# Altium schematic sheet TP4_Compact_FMC_Sht1.SchDoc
size B; SheetNumber: 1; SheetTotal: 2
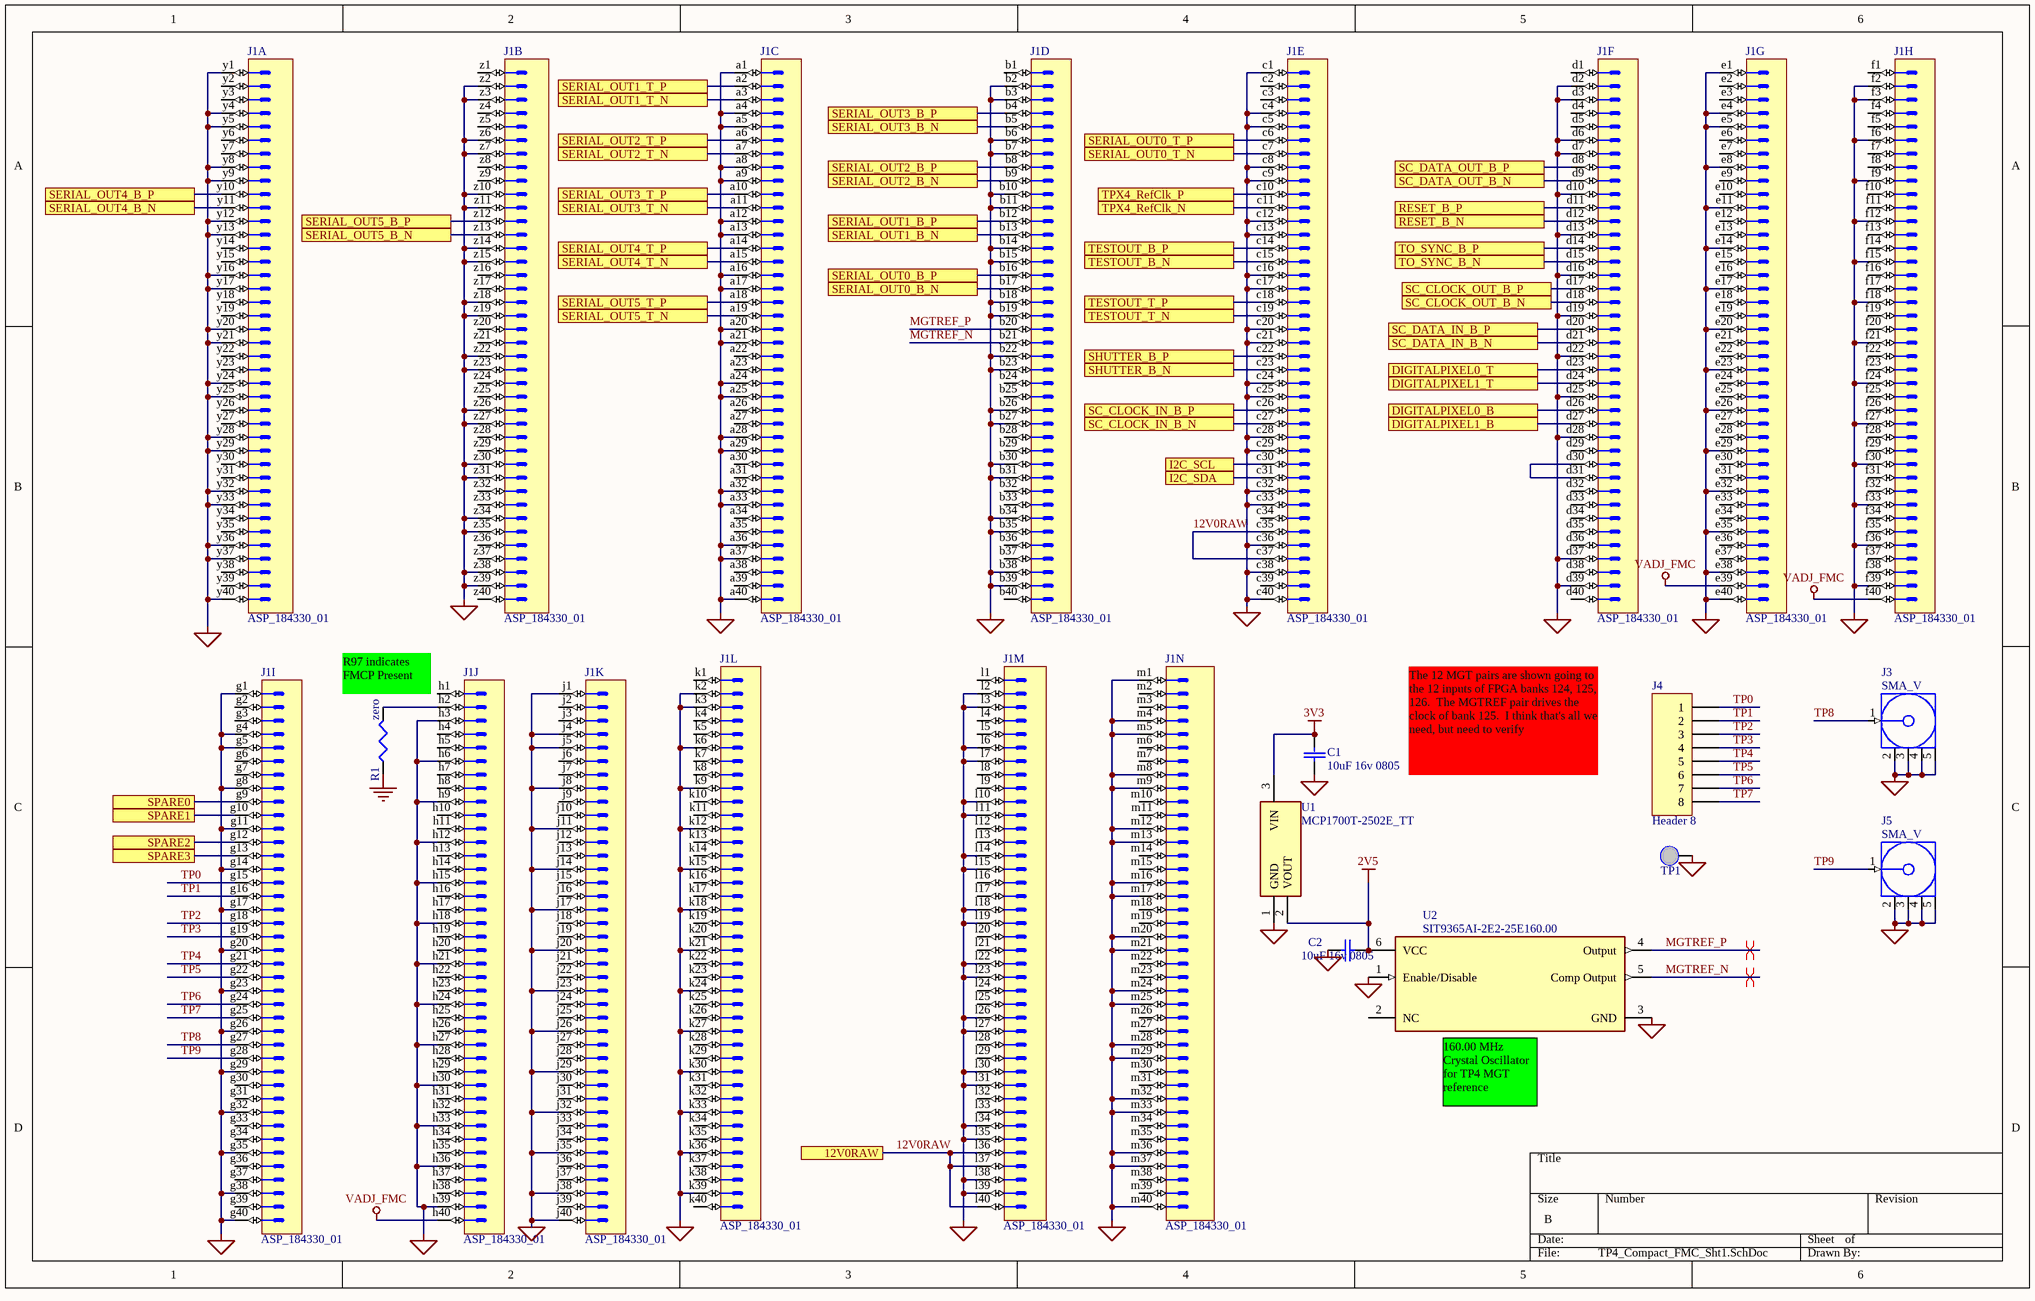
[diagram p0: TP4_Compact_FMC_Sht1.SchDoc]

## Parts
C1  value 10uF 16v 0805  [CAP0805]  (hidden comment: Cap)
C2  value 10uF 16v 0805  [CAP0805]  (hidden comment: Cap)
J1  ASP_184330_01  [SAMTEC_ASP_184330_01]  (parts A,B,C,D,E,F,G,H,I,J,K,L,M,N of 14)
J3  SMA_V  [SMA_Vert]
J4  Header 8  [HDR1X8]
J5  SMA_V  [SMA_Vert]
R1  value zero  [CAP0805]  (hidden comment: Res)
TP1  through-hole pad  [Pin1]  (value not drawn)
U1  MCP1700T-2502E_TT  [SOT95P237X112-3N]
U2  SIT9365AI-2E2-25E160.00  [osc_7mm_5mm]

## Ports
12V0RAW (see TP4_Compact_FMC_Sht2[1A]), DIGITALPIXEL0_B (see TP4_Compact_FMC_Sht2[6B]), DIGITALPIXEL0_T (see TP4_Compact_FMC_Sht2[6B]), DIGITALPIXEL1_B (see TP4_Compact_FMC_Sht2[6B]), DIGITALPIXEL1_T (see TP4_Compact_FMC_Sht2[6B]), I2C_SCL (see TP4_Compact_FMC_Sht2[4C]), I2C_SDA (see TP4_Compact_FMC_Sht2[6C]), RESET_B_N (see TP4_Compact_FMC_Sht2[4B]), RESET_B_P (see TP4_Compact_FMC_Sht2[4B]), SC_CLOCK_IN_B_N (see TP4_Compact_FMC_Sht2[4B]), SC_CLOCK_IN_B_P (see TP4_Compact_FMC_Sht2[4B]), SC_CLOCK_OUT_B_N (see TP4_Compact_FMC_Sht2[6B]), SC_CLOCK_OUT_B_P (see TP4_Compact_FMC_Sht2[6B]), SC_DATA_IN_B_N (see TP4_Compact_FMC_Sht2[6B]), SC_DATA_IN_B_P (see TP4_Compact_FMC_Sht2[6B]), SC_DATA_OUT_B_N (see TP4_Compact_FMC_Sht2[4B]), SC_DATA_OUT_B_P (see TP4_Compact_FMC_Sht2[4B]), SERIAL_OUT0_B_N (see TP4_Compact_FMC_Sht2[4A]), SERIAL_OUT0_B_P (see TP4_Compact_FMC_Sht2[4A]), SERIAL_OUT0_T_N (see TP4_Compact_FMC_Sht2[4A]), SERIAL_OUT0_T_P (see TP4_Compact_FMC_Sht2[4A]), SERIAL_OUT1_B_N (see TP4_Compact_FMC_Sht2[6A]), SERIAL_OUT1_B_P (see TP4_Compact_FMC_Sht2[6A]), SERIAL_OUT1_T_N (see TP4_Compact_FMC_Sht2[4A]), SERIAL_OUT1_T_P (see TP4_Compact_FMC_Sht2[4A]), SERIAL_OUT2_B_N (see TP4_Compact_FMC_Sht2[4A]), SERIAL_OUT2_B_P (see TP4_Compact_FMC_Sht2[4A]), SERIAL_OUT2_T_N (see TP4_Compact_FMC_Sht2[6A]), SERIAL_OUT2_T_P (see TP4_Compact_FMC_Sht2[6A]), SERIAL_OUT3_B_N (see TP4_Compact_FMC_Sht2[4A]), SERIAL_OUT3_B_P (see TP4_Compact_FMC_Sht2[4A]), SERIAL_OUT3_T_N (see TP4_Compact_FMC_Sht2[4A]), SERIAL_OUT3_T_P (see TP4_Compact_FMC_Sht2[4A]), SERIAL_OUT4_B_N (see TP4_Compact_FMC_Sht2[6A]), SERIAL_OUT4_B_P (see TP4_Compact_FMC_Sht2[6A]), SERIAL_OUT4_T_N (see TP4_Compact_FMC_Sht2[6A]), SERIAL_OUT4_T_P (see TP4_Compact_FMC_Sht2[6A]), SERIAL_OUT5_B_N (see TP4_Compact_FMC_Sht2[6A]), SERIAL_OUT5_B_P (see TP4_Compact_FMC_Sht2[6A]), SERIAL_OUT5_T_N (see TP4_Compact_FMC_Sht2[6A]), SERIAL_OUT5_T_P (see TP4_Compact_FMC_Sht2[6A]), SHUTTER_B_N (see TP4_Compact_FMC_Sht2[6B]), SHUTTER_B_P (see TP4_Compact_FMC_Sht2[6B]), SPARE0 (see TP4_Compact_FMC_Sht2[6B]), SPARE1 (see TP4_Compact_FMC_Sht2[6B]), SPARE2 (see TP4_Compact_FMC_Sht2[6B]), SPARE3 (see TP4_Compact_FMC_Sht2[6B]), TESTOUT_B_N (see TP4_Compact_FMC_Sht2[4B]), TESTOUT_B_P (see TP4_Compact_FMC_Sht2[4B]), TESTOUT_T_N (see TP4_Compact_FMC_Sht2[4B]), TESTOUT_T_P (see TP4_Compact_FMC_Sht2[4B]), TO_SYNC_B_N (see TP4_Compact_FMC_Sht2[4B]), TO_SYNC_B_P (see TP4_Compact_FMC_Sht2[4B]), TPX4_RefClk_N (see TP4_Compact_FMC_Sht2[4B]), TPX4_RefClk_P (see TP4_Compact_FMC_Sht2[4B])

## Nets
2V5: C2.1 U1.2(VOUT) U2.6(VCC)
3V3: C1.1 U1.3(VIN)
GND: C1.2 C2.2 J1.a1 J1.a4 J1.a5 J1.a8 J1.a9 J1.a12 J1.a13 J1.a16 J1.a17 J1.a20 J1.a21 J1.a24 J1.a25 J1.a28 J1.a29 J1.a32 J1.a33 J1.a36 J1.a37 J1.a40 J1.b2 J1.b3 J1.b6 J1.b7 J1.b10 J1.b11 J1.b14 J1.b15 J1.b18 J1.b19 J1.b22 J1.b23 J1.b26 J1.b27 J1.b30 J1.b31 J1.b34 J1.b35 J1.b38 J1.b39 J1.c1 J1.c4 J1.c5 J1.c8 J1.c9 J1.c12 J1.c13 J1.c16 J1.c17 J1.c20 J1.c21 J1.c24 J1.c25 J1.c28 J1.c29 J1.c32 J1.c33 J1.c36 J1.c38 J1.c40 J1.d2 J1.d3 J1.d6 J1.d7 J1.d10 J1.d13 J1.d16 J1.d19 J1.d22 J1.d25 J1.d28 J1.d37 J1.d39 J1.e1 J1.e4 J1.e5 J1.e8 J1.e11 J1.e14 J1.e17 J1.e20 J1.e23 J1.e26 J1.e29 J1.e32 J1.e35 J1.e38 J1.e40 J1.f2 J1.f3 J1.f6 J1.f9 J1.f12 J1.f15 J1.f18 J1.f21 J1.f24 J1.f27 J1.f30 J1.f33 J1.f36 J1.f39 J1.g1 J1.g4 J1.g5 J1.g8 J1.g11 J1.g14 J1.g17 J1.g20 J1.g23 J1.g26 J1.g29 J1.g32 J1.g35 J1.g38 J1.g40 J1.h3 J1.h6 J1.h9 J1.h12 J1.h15 J1.h18 J1.h21 J1.h24 J1.h27 J1.h30 J1.h33 J1.h36 J1.h39 J1.j1 J1.j4 J1.j5 J1.j8 J1.j11 J1.j14 J1.j17 J1.j20 J1.j23 J1.j26 J1.j29 J1.j32 J1.j35 J1.j38 J1.j40 J1.k2 J1.k3 J1.k6 J1.k9 J1.k12 J1.k15 J1.k18 J1.k21 J1.k24 J1.k27 J1.k30 J1.k33 J1.k36 J1.k39 J1.l2 J1.l3 J1.l6 J1.l7 J1.l10 J1.l11 J1.l14 J1.l15 J1.l18 J1.l19 J1.l22 J1.l23 J1.l26 J1.l27 J1.l30 J1.l31 J1.l34 J1.l35 J1.l38 J1.l39 J1.m1 J1.m4 J1.m5 J1.m8 J1.m9 J1.m12 J1.m13 J1.m16 J1.m17 J1.m20 J1.m21 J1.m24 J1.m25 J1.m28 J1.m29 J1.m32 J1.m33 J1.m36 J1.m37 J1.m40 J1.y1 J1.y4 J1.y5 J1.y8 J1.y9 J1.y12 J1.y13 J1.y16 J1.y17 J1.y20 J1.y21 J1.y24 J1.y25 J1.y28 J1.y29 J1.y32 J1.y33 J1.y36 J1.y37 J1.y40 J1.z2 J1.z3 J1.z6 J1.z7 J1.z10 J1.z11 J1.z14 J1.z15 J1.z18 J1.z19 J1.z22 J1.z23 J1.z26 J1.z27 J1.z30 J1.z31 J1.z34 J1.z35 J1.z38 J1.z39 J3.2(GND) J3.3(GND) J3.4(GND) J3.5(GND) J5.2(GND) J5.3(GND) J5.4(GND) J5.5(GND) R1.1 TP1.1 U1.1(GND) U2.1(Enable/Disable) U2.3(GND)
VADJ_FMC: J1.e39 J1.f40 J1.h40
12V0RAW: J1.c35 J1.c37 J1.l36 J1.l37 J1.l40 ; port 12V0RAW
DIGITALPIXEL0_B: J1.d26 ; port DIGITALPIXEL0_B
DIGITALPIXEL0_T: J1.d23 ; port DIGITALPIXEL0_T
DIGITALPIXEL1_B: J1.d27 ; port DIGITALPIXEL1_B
DIGITALPIXEL1_T: J1.d24 ; port DIGITALPIXEL1_T
I2C_SCL: J1.c30 ; port I2C_SCL
I2C_SDA: J1.c31 ; port I2C_SDA
MGTREF_N: J1.b21 U2.5(Comp_Output)
MGTREF_P: J1.b20 U2.4(Output)
RESET_B_N: J1.d12 ; port RESET_B_N
RESET_B_P: J1.d11 ; port RESET_B_P
SC_CLOCK_IN_B_N: J1.c27 ; port SC_CLOCK_IN_B_N
SC_CLOCK_IN_B_P: J1.c26 ; port SC_CLOCK_IN_B_P
SC_CLOCK_OUT_B_N: J1.d18 ; port SC_CLOCK_OUT_B_N
SC_CLOCK_OUT_B_P: J1.d17 ; port SC_CLOCK_OUT_B_P
SC_DATA_IN_B_N: J1.d21 ; port SC_DATA_IN_B_N
SC_DATA_IN_B_P: J1.d20 ; port SC_DATA_IN_B_P
SC_DATA_OUT_B_N: J1.d9 ; port SC_DATA_OUT_B_N
SC_DATA_OUT_B_P: J1.d8 ; port SC_DATA_OUT_B_P
SERIAL_OUT0_B_N: J1.b17 ; port SERIAL_OUT0_B_N
SERIAL_OUT0_B_P: J1.b16 ; port SERIAL_OUT0_B_P
SERIAL_OUT0_T_N: J1.c7 ; port SERIAL_OUT0_T_N
SERIAL_OUT0_T_P: J1.c6 ; port SERIAL_OUT0_T_P
SERIAL_OUT1_B_N: J1.b13 ; port SERIAL_OUT1_B_N
SERIAL_OUT1_B_P: J1.b12 ; port SERIAL_OUT1_B_P
SERIAL_OUT1_T_N: J1.a3 ; port SERIAL_OUT1_T_N
SERIAL_OUT1_T_P: J1.a2 ; port SERIAL_OUT1_T_P
SERIAL_OUT2_B_N: J1.b9 ; port SERIAL_OUT2_B_N
SERIAL_OUT2_B_P: J1.b8 ; port SERIAL_OUT2_B_P
SERIAL_OUT2_T_N: J1.a7 ; port SERIAL_OUT2_T_N
SERIAL_OUT2_T_P: J1.a6 ; port SERIAL_OUT2_T_P
SERIAL_OUT3_B_N: J1.b5 ; port SERIAL_OUT3_B_N
SERIAL_OUT3_B_P: J1.b4 ; port SERIAL_OUT3_B_P
SERIAL_OUT3_T_N: J1.a11 ; port SERIAL_OUT3_T_N
SERIAL_OUT3_T_P: J1.a10 ; port SERIAL_OUT3_T_P
SERIAL_OUT4_B_N: J1.y11 ; port SERIAL_OUT4_B_N
SERIAL_OUT4_B_P: J1.y10 ; port SERIAL_OUT4_B_P
SERIAL_OUT4_T_N: J1.a15 ; port SERIAL_OUT4_T_N
SERIAL_OUT4_T_P: J1.a14 ; port SERIAL_OUT4_T_P
SERIAL_OUT5_B_N: J1.z13 ; port SERIAL_OUT5_B_N
SERIAL_OUT5_B_P: J1.z12 ; port SERIAL_OUT5_B_P
SERIAL_OUT5_T_N: J1.a19 ; port SERIAL_OUT5_T_N
SERIAL_OUT5_T_P: J1.a18 ; port SERIAL_OUT5_T_P
SHUTTER_B_N: J1.c23 ; port SHUTTER_B_N
SHUTTER_B_P: J1.c22 ; port SHUTTER_B_P
SPARE0: J1.g9 ; port SPARE0
SPARE1: J1.g10 ; port SPARE1
SPARE2: J1.g12 ; port SPARE2
SPARE3: J1.g13 ; port SPARE3
TESTOUT_B_N: J1.c15 ; port TESTOUT_B_N
TESTOUT_B_P: J1.c14 ; port TESTOUT_B_P
TESTOUT_T_N: J1.c19 ; port TESTOUT_T_N
TESTOUT_T_P: J1.c18 ; port TESTOUT_T_P
TO_SYNC_B_N: J1.d15 ; port TO_SYNC_B_N
TO_SYNC_B_P: J1.d14 ; port TO_SYNC_B_P
TP0: J1.g15 J4.1
TP1: J1.g16 J4.2
TP2: J1.g18 J4.3
TP3: J1.g19 J4.4
TP4: J1.g21 J4.5
TP5: J1.g22 J4.6
TP6: J1.g24 J4.7
TP7: J1.g25 J4.8
TP8: J1.g27 J3.1(Signal)
TP9: J1.g28 J5.1(Signal)
TPX4_RefClk_N: J1.c11 ; port TPX4_RefClk_N
TPX4_RefClk_P: J1.c10 ; port TPX4_RefClk_P
NetJ1_d30: J1.d30 J1.d31
NetJ1_h2: J1.h2 R1.2

Not connected (* = marked no-connect by the designer): J1 a22 a23 a26 a27 a30 a31 a34 a35 a38 a39 b1 b24 b25 b28 b29 b32 b33 b36 b37 b40 c2 c3 c34 c39 d1 d4 d5 d29 d32 d33 d34 d35 d36 d38 d40 e2 e3 e6 e7 e9 e10 e12 e13 e15 e16 e18 e19 e21 e22 e24 e25 e27 e28 e30 e31 e33 e34 e36 e37 f1 f4 f5 f7 f8 f10 f11 f13 f14 f16 f17 f19 f20 f22 f23 f25 f26 f28 f29 f31 f32 f34 f35 f37 f38 g2 g3 g6 g7 g30 g31 g33 g34 g36 g37 g39 h1 h4 h5 h7 h8 h10 h11 h13 h14 h16 h17 h19 h20 h22 h23 h25 h26 h28 h29 h31 h32 h34 h35 h37 h38 j2 j3 j6 j7 j9 j10 j12 j13 j15 j16 j18 j19 j21 j22 j24 j25 j27 j28 j30 j31 j33 j34 j36 j37 j39 k1 k4 k5 k7 k8 k10 k11 k13 k14 k16 k17 k19 k20 k22 k23 k25 k26 k28 k29 k31 k32 k34 k35 k37 k38 k40 l1 l4 l5 l8 l9 l12 l13 l16 l17 l20 l21 l24 l25 l28 l29 l32 l33 m2 m3 m6 m7 m10 m11 m14 m15 m18 m19 m22 m23 m26 m27 m30 m31 m34 m35 m38 m39 y2 y3 y6 y7 y14 y15 y18 y19 y22 y23 y26 y27 y30 y31 y34 y35 y38 y39 z1 z4 z5 z8 z9 z16 z17 z20 z21 z24 z25 z28 z29 z32 z33 z36 z37 z40; U2 2(NC)

## Layout directives
differential pair: MGTREF_N, MGTREF_P

## Notes on the sheet
- R97 indicates FMCP Present
- The 12 MGT pairs are shown going to the 12 inputs of FPGA banks 124, 125, 126.  The MGTREF pair drives the clock of bank 125.  I think that's all we need, but need to verify
- (near U2) 160.00 MHz Crystal Oscillator for TP4 MGT reference

## Library data of the parts
C1 C2 = Cap: Capacitor, ceramic SM; OrderNo: 1276-2872-1-ND; CostEach: 0; Supplier: Digikey
J1 = FMCplus: CostEach: 0; OrderNo: SAM9173-ND; Supplier: Digikey
J3 J5 = COAX-F: Vertical mount SMA; PCB_Layout: Complies with manufacturer's recommendation.; DrillSize: Corresponds to nominal value.; OrderNo: SAM10718-ND; Published: 15-Jul-2004; LatestRevisionDate: 15-Jul-2004; LatestRevisionNote: Component Replaced.; DatasheetDocument: 30-May-2003; PackageDocument: 04-Jul-1999; PackageReference: 919-119J-51AX; Publisher: Altium Limited; ComponentLink1Description: Manufacturer Link; ComponentLink1URL: http://www.amphenolrf.com/
J4 = Header 8: Header, 8-Pin; LatestRevisionDate: 17-Jul-2002; LatestRevisionNote: Re-released for DXP Platform.; Publisher: Altium Limited
R1 = Res3: Resistor; OrderNo: P0.0GCT; CostEach: 0; Published: 8-Jun-2000; LatestRevisionDate: 29-May-2009; LatestRevisionNote: IPC-7351 Footprint Added.; PackageReference: J1-0603; Publisher: Altium Limited; PackageDescription: Chip Resistor; Supplier: Digikey
TP1 = testpoint: EM_PN: DNP; Supplier: Digikey
U1 = MCP1700T-2502E_TT: Integrated Circuit; Manufacturer_Name: Microchip; Manufacturer_Part_Number: MCP1700T-2502E/TT; OrderNo: MCP1700T-2502E/TTCT-ND; Datasheet Link: https://datasheet.datasheetarchive.com/originals/distributors/Datasheets-DGA25/1767215.pdf; Height: 1.12mm; Mouser Part Number: 579-MCP1700T2502E/TT; Mouser Price/Stock: https://www.mouser.co.uk/ProductDetail/Microchip-Technology/MCP1700T-2502E-TT?qs=fM4xO01eazNo%2FPEFFkh6Nw%3D%3D; Arrow Part Number: MCP1700T-2502E/TT; Arrow Price/Stock: https://www.arrow.com/en/products/mcp1700t-2502ett/microchip-technology?utm_currency=USD&region=nac
U2 = CCLD-033-50-100.000: OrderNo: 1473-SIT9365AI-2E2-25E160.000000-ND; Supplier: Digikey